# Altium project starfish.PrjPcb
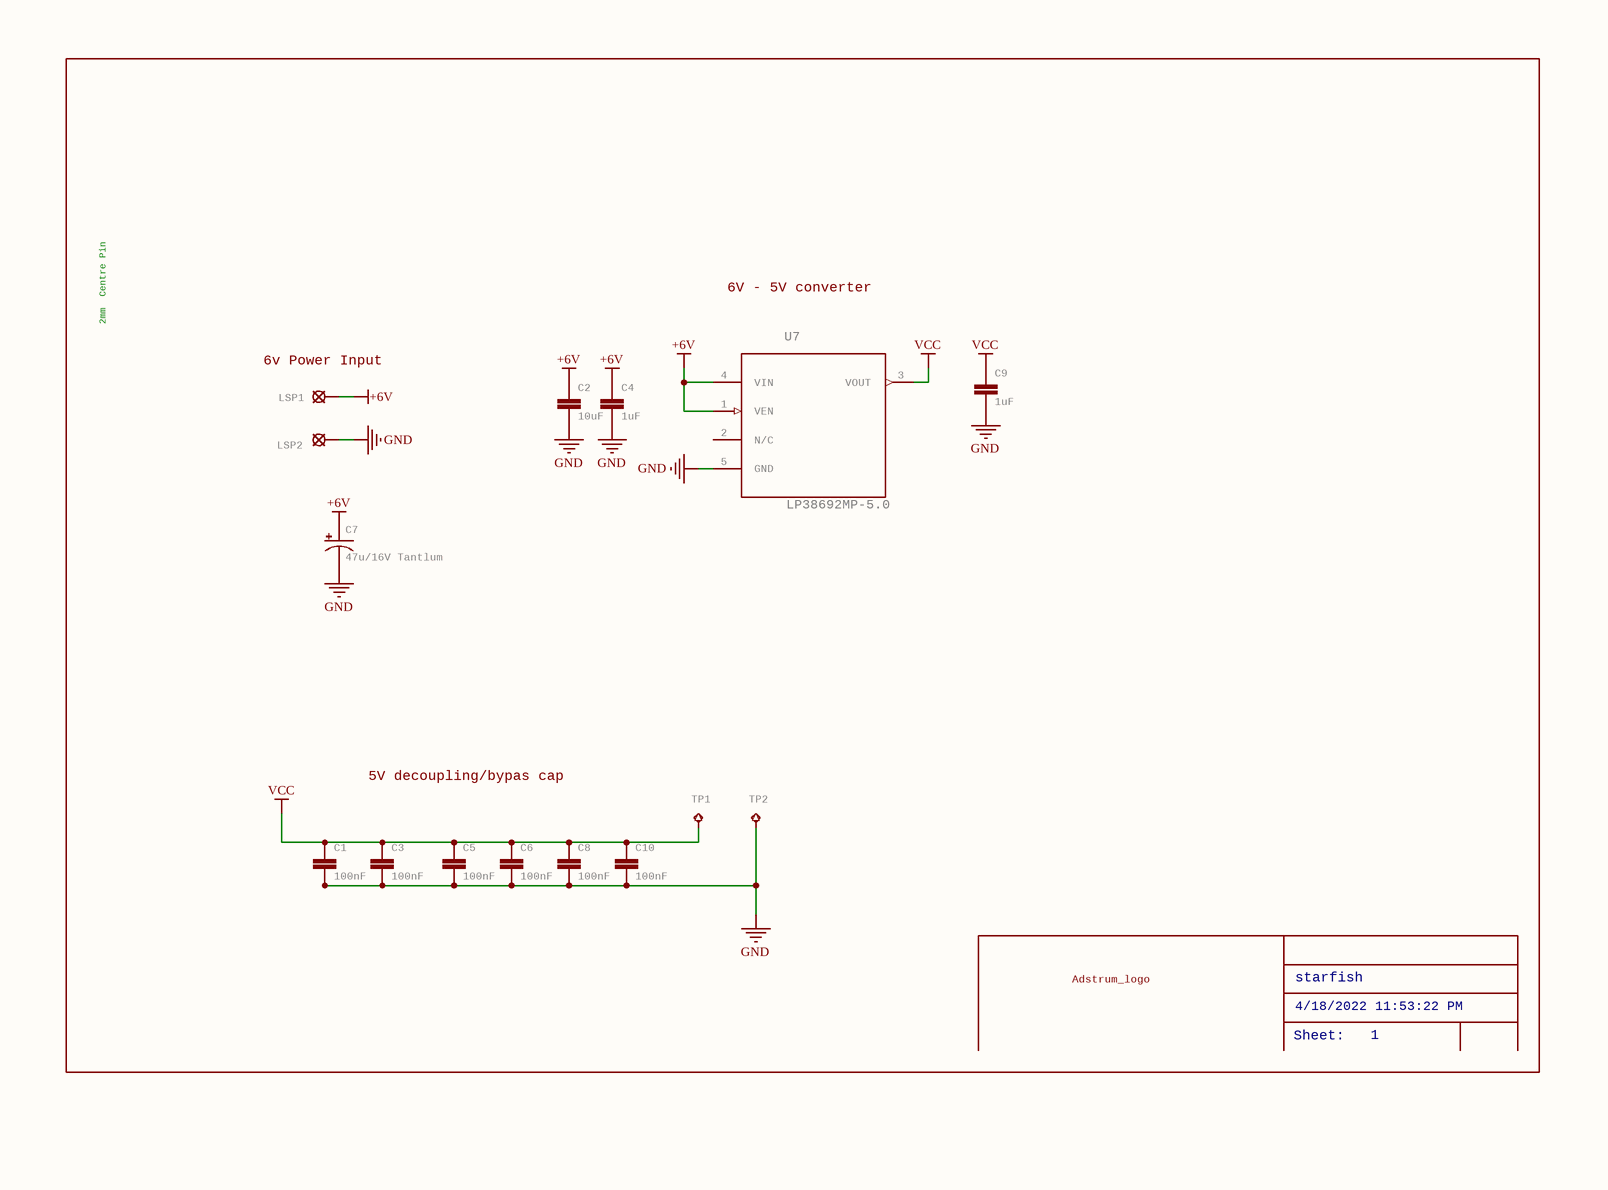
[diagram p0: starfish_0.SchDoc]
6 sheets, 60 parts. Net scope: flat (ports and power ports of the same name join across sheets).
Sheets:
  starfish_0.SchDoc
  starfish_1.SchDoc
  starfish_2.SchDoc
  starfish_3.SchDoc
  starfish_4.SchDoc
  starfish_5.SchDoc

## Sheet starfish_0.SchDoc: starfish
size 282 x 208 mm; Origin: Eagle; Date: 4/18/2022 11:53:22 PM; SheetNumber: 1; GateName_1: G$1; SymbolName_1: A4L-LOC; LibraryName: frames; DeviceSetName: A4L-LOC; Sheet: Sheet:

### Parts
C1  100nF  [C1210]
C2  10uF  [C0805]
C3  100nF  [C0603]
C4  1uF  [C0805]
C5  100nF  [C0603]
C6  100nF  [C0603]
C7  47u/16V Tantlum  [C/6032-28R]
C8  100nF  [C0603]
C9  1uF  [C0805]
C10  100nF  [C0603]
LSP1  LSP10  [LSP10]  (value not drawn)
LSP2  LSP10  [LSP10]  (value not drawn)
TP1  vcc  [B1,27]  (value not drawn)
TP2  gnd  [B1,27]  (value not drawn)
U7  LP38692MP-5.0  [SOT150P696X180-5N]
U$16  ADSTRUM_LOGO  [ADSTRUM_LOGO]

### Nets
+6V: C2.1 C4.1 C7.+ LSP1.MP U7.1(VEN) U7.4(VIN)
GND: C1.2 C2.2 C3.2 C4.2 C5.2 C6.2 C7.- C8.2 C9.2 C10.2 LSP2.MP TP2.TP U7.5(GND)
VCC: C1.1 C3.1 C5.1 C6.1 C8.1 C9.1 C10.1 TP1.TP U7.3(VOUT)

Not connected (* = marked no-connect by the designer): U7 2(N/C)

### Notes on the sheet
- 2mm  Centre Pin
- 6V - 5V converter
- (near LSP1) 6v Power Input
- 5V decoupling/bypas cap
- starfish
- Sheet:
- 4/18/2022 11:53:22 PM
- 1

### Library data of the parts
C1 = C-EUC1210: CAPACITOR, European symbol; GateName_1: G$1; SymbolName_1: C-EU; DeviceName: C1210; LibraryName: resistor; DeviceSetName: C-EU
C2 C4 C9 = C-EUC0805: CAPACITOR, European symbol; GateName_1: G$1; SymbolName_1: C-EU; DeviceName: C0805; LibraryName: resistor; DeviceSetName: C-EU
C3 C5 C6 C8 C10 = C-EUC0603: CAPACITOR, European symbol; GateName_1: G$1; SymbolName_1: C-EU; DeviceName: C0603; LibraryName: resistor; DeviceSetName: C-EU
C7 = CPOL-USC/6032-28R: POLARIZED CAPACITOR, American symbol; GateName_1: G$1; POPULARITY: 0; SymbolName_1: CPOL-US; DeviceName: C/6032-28R; LibraryName: rcl; DeviceSetName: CPOL-US; SPICEPREFIX: C
LSP1 LSP2 = LSP10: SOLDER PAD    drill 1.0 mm, distributor Buerklin, 12H555; GateName_1: 1; SymbolName_1: LSP; POPULARITY: 52; LibraryName: solpad; DeviceSetName: LSP10
TP1 TP2 = TPB1,27: Test pad; GateName_1: G$1; SymbolName_1: TP; POPULARITY: 19; DeviceName: B1,27; LibraryName: testpad; DeviceSetName: TP
U7 = LP38692MP-5.0: Linear  Regulator Check availability; GateName_1: A; DESCRIPTION: 1-A, 10-V, low-dropout voltage regulator with enable; MF: Texas Instruments; MP: LP38692MP-5.0/NOPB; SymbolName_1: LP38692MP-5.0; LibraryName: LP38692MP-5.0; DeviceSetName: LP38692MP-5.0; AVAILABILITY: In Stock; PACKAGE: SOT-223-5 Texas Instruments; PRICE: None; PURCHASE-URL: https://pricing.snapeda.com/search/part/LP38692MP-5.0/NOPB/?ref=eda
U$16 = ADSTRUM_LOGO: ADSTRUM LOGO; GateName_1: G$1; SymbolName_1: ADSTRUM_LOGO; LibraryName: ADSTRUM_LOGO; DeviceSetName: ADSTRUM_LOGO; Adstrum_logo: Adstrum_logo

## Sheet starfish_1.SchDoc: starfish
size 409 x 289 mm; Origin: Eagle; Date: 4/18/2022 11:53:22 PM; SheetNumber: 2; GateName_1: G$1; SymbolName_1: A3L-LOC; LibraryName: frames; DeviceSetName: A3L-LOC; Sheet: Sheet:
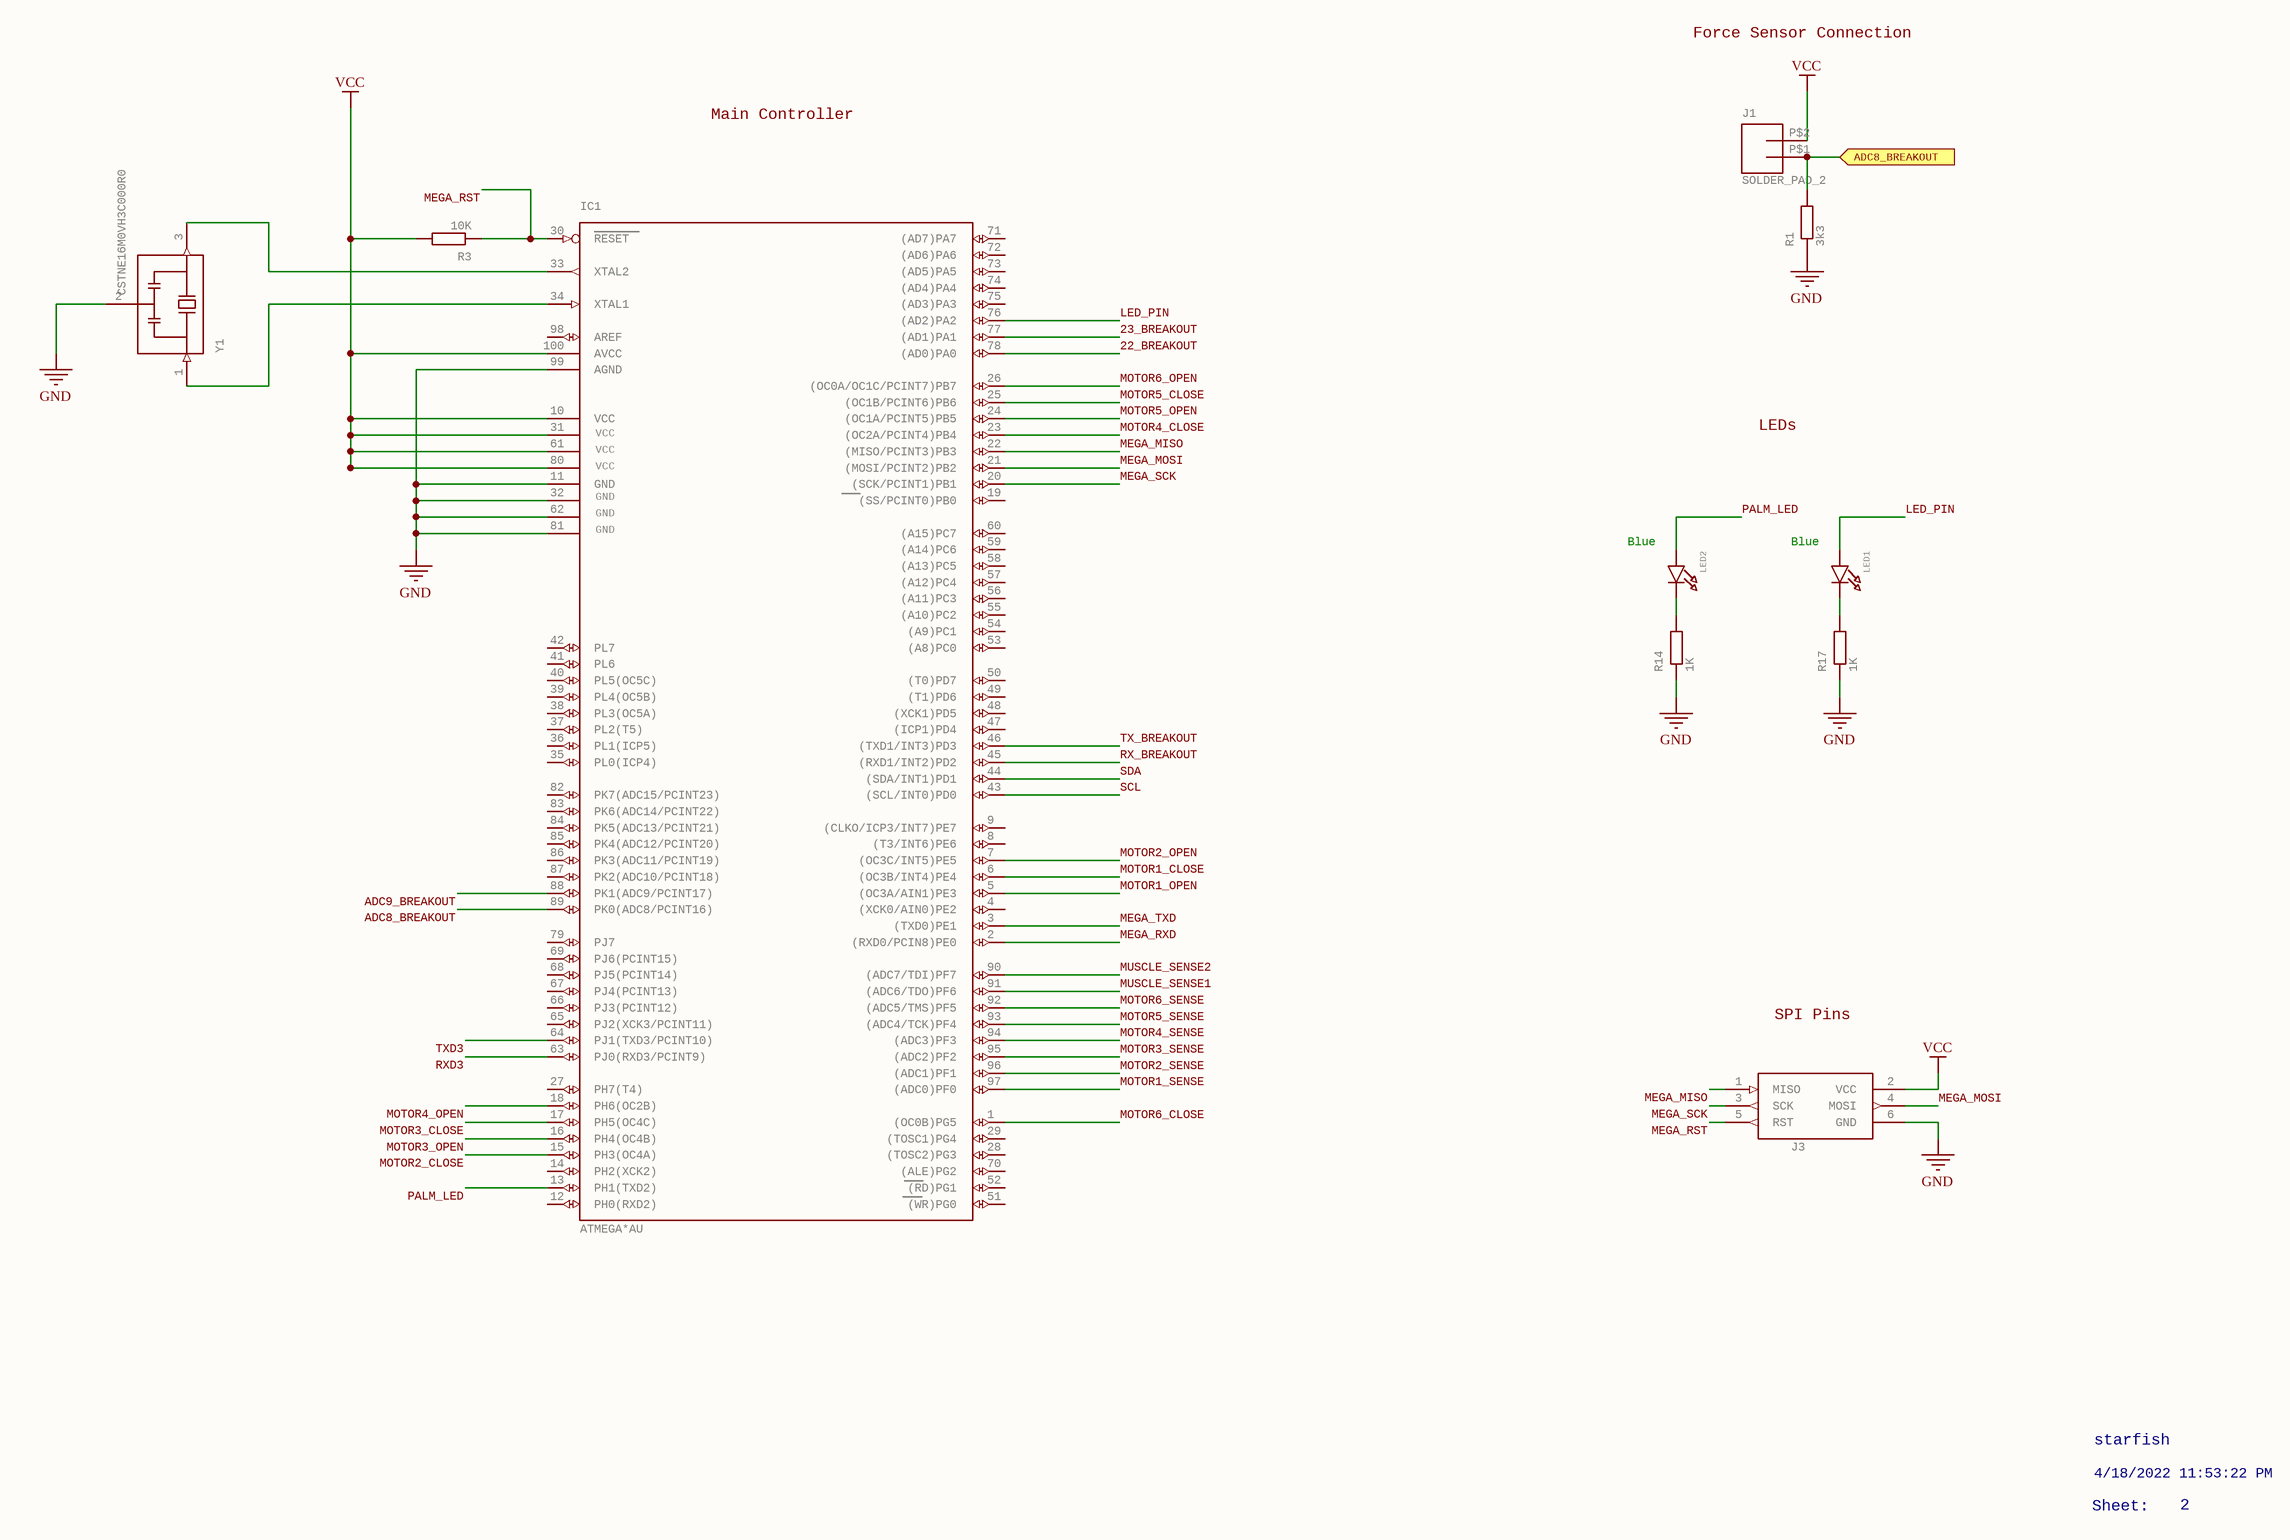
[diagram p1: starfish_1.SchDoc]

### Parts
IC1  ATMEGA*AU  [TQFP100]
J1  SOLDER_PAD_2  [SOLDER_PAD_2]
J3  DNF  [AVRISP]  (value not drawn)
LED1  LED0805  [CHIPLED_0805]  (value not drawn)
LED2  LED0805  [CHIPLED_0805]  (value not drawn)
R1  3k3  [R0603]
R3  10K  [R0603]
R14  1K  [R0603]
R17  1K  [R0603]
Y1  CSTNE16M0VH3C000R0  [OSC_CSTNE16M0VH3C000R0]

### Ports
ADC8_BREAKOUT (in)

### Nets
GND: IC1.11(GND) IC1.32(GND1) IC1.62(GND2) IC1.81(GND3) IC1.99(AGND) J3.6(GND) R1.1 R14.1 R17.1 Y1.2(GND)
VCC: IC1.10(VCC) IC1.31(VCC1) IC1.61(VCC2) IC1.80(VCC3) IC1.100(AVCC) J1.P$2 J3.2(VCC) R3.2
22_BREAKOUT: IC1.78((AD0)PA0)
23_BREAKOUT: IC1.77((AD1)PA1)
ADC8_BREAKOUT: IC1.89(PK0(ADC8/PCINT16))
ADC9_BREAKOUT: IC1.88(PK1(ADC9/PCINT17))
LED_PIN: IC1.76((AD2)PA2) LED1.A
MEGA_MISO: IC1.22((MISO/PCINT3)PB3) J3.1(MISO)
MEGA_MOSI: IC1.21((MOSI/PCINT2)PB2) J3.4(MOSI)
MEGA_RST: IC1.30(RESET) J3.5(RST) R3.1
MEGA_RXD: IC1.2((RXD0/PCIN8)PE0)
MEGA_SCK: IC1.20((SCK/PCINT1)PB1) J3.3(SCK)
MEGA_TXD: IC1.3((TXD0)PE1)
MOTOR1_CLOSE: IC1.6((OC3B/INT4)PE4)
MOTOR1_OPEN: IC1.5((OC3A/AIN1)PE3)
MOTOR1_SENSE: IC1.97((ADC0)PF0)
MOTOR2_CLOSE: IC1.15(PH3(OC4A))
MOTOR2_OPEN: IC1.7((OC3C/INT5)PE5)
MOTOR2_SENSE: IC1.96((ADC1)PF1)
MOTOR3_CLOSE: IC1.17(PH5(OC4C))
MOTOR3_OPEN: IC1.16(PH4(OC4B))
MOTOR3_SENSE: IC1.95((ADC2)PF2)
MOTOR4_CLOSE: IC1.23((OC2A/PCINT4)PB4)
MOTOR4_OPEN: IC1.18(PH6(OC2B))
MOTOR4_SENSE: IC1.94((ADC3)PF3)
MOTOR5_CLOSE: IC1.25((OC1B/PCINT6)PB6)
MOTOR5_OPEN: IC1.24((OC1A/PCINT5)PB5)
MOTOR5_SENSE: IC1.93((ADC4/TCK)PF4)
MOTOR6_CLOSE: IC1.1((OC0B)PG5)
MOTOR6_OPEN: IC1.26((OC0A/OC1C/PCINT7)PB7)
MOTOR6_SENSE: IC1.92((ADC5/TMS)PF5)
MUSCLE_SENSE1: IC1.91((ADC6/TDO)PF6)
MUSCLE_SENSE2: IC1.90((ADC7/TDI)PF7)
PALM_LED: IC1.13(PH1(TXD2)) LED2.A
RX_BREAKOUT: IC1.45((RXD1/INT2)PD2)
RXD3: IC1.63(PJ0(RXD3/PCINT9))
SCL: IC1.43((SCL/INT0)PD0)
SDA: IC1.44((SDA/INT1)PD1)
TX_BREAKOUT: IC1.46((TXD1/INT3)PD3)
TXD3: IC1.64(PJ1(TXD3/PCINT10))
NetIC1_33: IC1.33(XTAL2) Y1.3(OUT)
NetIC1_34: IC1.34(XTAL1) Y1.1(IN)
NetJ1_P$1: J1.P$1 R1.2 ; port ADC8_BREAKOUT
NetLED1_C: LED1.C R17.2
NetLED2_C: LED2.C R14.2

Not connected (* = marked no-connect by the designer): IC1 4((XCK0/AIN0)PE2) 8((T3/INT6)PE6) 9((CLKO/ICP3/INT7)PE7) 12(PH0(RXD2)) 14(PH2(XCK2)) 19((SS/PCINT0)PB0) 27(PH7(T4)) 28((TOSC2)PG3) 29((TOSC1)PG4) 35(PL0(ICP4)) 36(PL1(ICP5)) 37(PL2(T5)) 38(PL3(OC5A)) 39(PL4(OC5B)) 40(PL5(OC5C)) 41(PL6) 42(PL7) 47((ICP1)PD4) 48((XCK1)PD5) 49((T1)PD6) 50((T0)PD7) 51((WR)PG0) 52((RD)PG1) 53((A8)PC0) 54((A9)PC1) 55((A10)PC2) 56((A11)PC3) 57((A12)PC4) 58((A13)PC5) 59((A14)PC6) 60((A15)PC7) 65(PJ2(XCK3/PCINT11)) 66(PJ3(PCINT12)) 67(PJ4(PCINT13)) 68(PJ5(PCINT14)) 69(PJ6(PCINT15)) 70((ALE)PG2) 71((AD7)PA7) 72((AD6)PA6) 73((AD5)PA5) 74((AD4)PA4) 75((AD3)PA3) 79(PJ7) 82(PK7(ADC15/PCINT23)) 83(PK6(ADC14/PCINT22)) 84(PK5(ADC13/PCINT21)) 85(PK4(ADC12/PCINT20)) 86(PK3(ADC11/PCINT19)) 87(PK2(ADC10/PCINT18)) 98(AREF)

### Notes on the sheet
- Force Sensor Connection
- Main Controller
- LEDs
- (near LED2) Blue
- (near LED1) Blue
- SPI Pins
- starfish
- Sheet:
- 4/18/2022 11:53:22 PM
- 2

### Library data of the parts
IC1 = ATMEGA*AU: MICROCONTROLLER   64/128/256 Kbytes FLASH   4 Kbytes EEPROM   8 Kbytes SRAM   86 General Purpose I/O pins   12-channels16-bit PWM   4 x Serial USARTs   16-channels 10-bit A/D; GateName_1: 1; SymbolName_1: 86-I/O-1; DeviceName: AU; LibraryName: atmel-2005; DeviceSetName: ATMEGA*; GND: GND; VCC: VCC
J1 = SOLDER_PAD_2: Solder Pad for LuMini Rings; GateName_1: G$1; SymbolName_1: CONN_02; LibraryName: SparkFun-Connectors; DeviceSetName: SOLDER_PAD_2
J3 = AVRISP-6: AVR ISP HEADER Standard 6 pin header for AVR programming; GateName_1: G$1; DeviceName: -6; SymbolName_1: AVRISP; LibraryName: adafruit; DeviceSetName: AVRISP
LED1 LED2 = LED0805: LED0603 - 0603 Surface Mount Package    2mA: Green LED - Low Power (3.9mcd, 2ma, 1.7Vf) - Digikey: 475-2709-2-ND  Orange LED - Low Power (9.8mcd, 2ma, 1.8Vf) - Digikey: 475-1194-2-ND  Red LED - Low Power (5mcd, 2ma, 1.8Vf) - Digikey: 475-1195-2-ND  Yellow LED - Low Power (7mcd, 2ma, 1.8Vf) - Digikey: 475-1196-2-ND       5mA: Blue LED - Low Power (17mcd, 5ma, 2.9Vf) - Digikey: LNJ937W8CRACT-ND    0805 - 0805 Surface Mount Package    2mA: Red LED (8.8mcd, 2mA, 1.8Vf, Clear) - Low Power [Digikey: 475-2510-1-ND]  Green LED (5mcd, 2mA, 1.8Vf, Clear) - Low Power [Digikey: 475-2730-1-ND]  Yellow LED (11.3mcd, 2mA, 1.8Vf, Clear) - Low Power [Digikey: 475-2555-1-ND]       20mA: Red LED (104mcd, 20mA, Diffused) - LS R976 [Digikey: 475-1278-6-ND]  Red LED (12mcd, 20mA, 2.0Vf, Clear) - APT2012EC [Digikey: 754-1128-1-ND]  Green LED (15mcd, 20mA, 2.2Vf, Clear) - APT2012GC [Digikey: 754-1131-1-ND]  Orange LED (160mcd, 20mA, 2.1Vf, Clear) - APT2012SECK [Digikey: 754-1130-1-ND]     1206 - 1206 Surface Mount Package  Green LED (26mcd, 20mA, Diffused) - LG N971  [Digikey: 475-1407-6-ND]  Red LED (15mcd, 20mA, Diffused) - LH N974 [Digikey: 475-1416-6-ND]; GateName_1: G$1; DeviceName: 0805; SymbolName_1: LED; LibraryName: microbuilder; DeviceSetName: LED
R1 R3 R14 R17 = R-EU_R0603: RESISTOR, European symbol; GateName_1: G$1; SymbolName_1: R-EU; DeviceSetName: R-EU_; DeviceName: R0603; LibraryName: resistor
Y1 = CSTNE16M0VH3C000R0: 16MHz Ceramic Resonator Built in Capacitor 15pF Â±0.15% 40 Ohms -40Â°C ~ 125Â°C Surface Mount  Check availability; GateName_1: G$1; DESCRIPTION: 16 MHz Ceramic Resonator Built in Capacitor 15 pF ±0.13% 40 Ohms -40°C ~ 125°C Surface Mount; MF: Murata Electronics North America; SymbolName_1: CSTNE16M0VH3C000R0; LibraryName: CSTNE16M0VH3C000R0; DeviceSetName: CSTNE16M0VH3C000R0; AVAILABILITY: In Stock; MP: CSTNE16M0VH3C000R0; PACKAGE: SMD-3 Murata; PRICE: None; PURCHASE-URL: https://pricing.snapeda.com/search/part/CSTNE16M0VH3C000R0/?ref=eda

## Sheet starfish_2.SchDoc: starfish
size 282 x 208 mm; Origin: Eagle; Date: 4/18/2022 11:53:22 PM; SheetNumber: 3; GateName_1: G$1; SymbolName_1: A4L-LOC; LibraryName: frames; DeviceSetName: A4L-LOC; Sheet: Sheet:
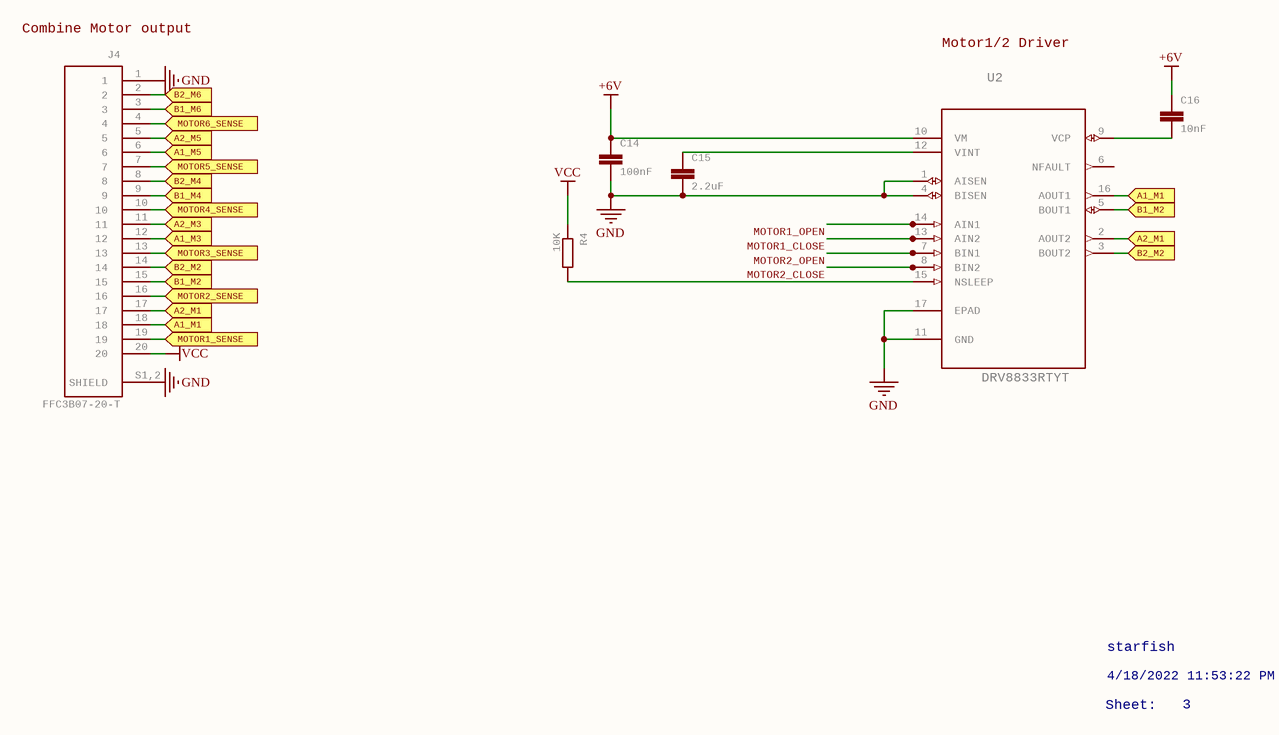
[diagram p2: starfish_2.SchDoc]

### Parts
C14  100nF  [C0603]
C15  2.2uF  [C0603]
C16  10nF  [C0603]
J4  FFC3B07-20-T  [GCT_FFC3B07-20-T]
R4  10K  [R0603]
U2  DRV8833RTYT  [QFN65P400X400X80-17N]

### Ports
A1_M1 (in), A1_M3 (in), A1_M5 (in), A2_M1 (in), A2_M3 (in), A2_M5 (in), B1_M2 (in), B1_M4 (in), B1_M6 (in), B2_M2 (in), B2_M4 (in), B2_M6 (in), MOTOR1_SENSE (in), MOTOR2_SENSE (in), MOTOR3_SENSE (in), MOTOR4_SENSE (in), MOTOR5_SENSE (in), MOTOR6_SENSE (in)

### Nets
+6V: C14.1 C16.1 U2.10(VM)
GND: C14.2 C15.2 J4.1 J4.S1,2(SHIELD) U2.1(AISEN) U2.4(BISEN) U2.11(GND) U2.17(EPAD)
VCC: J4.20 R4.1
MOTOR1_CLOSE: U2.13(AIN2)
MOTOR1_OPEN: U2.14(AIN1)
MOTOR2_CLOSE: U2.8(BIN2)
MOTOR2_OPEN: U2.7(BIN1)
NetC15_1: C15.1 U2.12(VINT)
NetC16_2: C16.2 U2.9(VCP)
NetJ4_2: J4.2 ; port B2_M6
NetJ4_3: J4.3 ; port B1_M6
NetJ4_4: J4.4 ; port MOTOR6_SENSE
NetJ4_5: J4.5 ; port A2_M5
NetJ4_6: J4.6 ; port A1_M5
NetJ4_7: J4.7 ; port MOTOR5_SENSE
NetJ4_8: J4.8 ; port B2_M4
NetJ4_9: J4.9 ; port B1_M4
NetJ4_10: J4.10 ; port MOTOR4_SENSE
NetJ4_11: J4.11 ; port A2_M3
NetJ4_12: J4.12 ; port A1_M3
NetJ4_13: J4.13 ; port MOTOR3_SENSE
NetJ4_14: J4.14 U2.3(BOUT2) ; port B2_M2
NetJ4_15: J4.15 U2.5(BOUT1) ; port B1_M2
NetJ4_16: J4.16 ; port MOTOR2_SENSE
NetJ4_17: J4.17 U2.2(AOUT2) ; port A2_M1
NetJ4_18: J4.18 U2.16(AOUT1) ; port A1_M1
NetJ4_19: J4.19 ; port MOTOR1_SENSE
NetR4_2: R4.2 U2.15(NSLEEP)

Not connected (* = marked no-connect by the designer): U2 6(NFAULT)

### Notes on the sheet
- (near J4) Combine Motor output
- Motor1/2 Driver
- starfish
- Sheet:
- 4/18/2022 11:53:22 PM
- 3

### Library data of the parts
C14-C16 = C-EUC0603: as C3 on sheet starfish_0; DeviceName: C0603; LibraryName: resistor; DeviceSetName: C-EU
J4 = FFC3B07-20-T: FPC 1.0mm Pitch, Side entry, Top contact, SMT, Height 2.5mm, Slide type Check availability; GateName_1: G$1; DESCRIPTION: 20 Position FFC, FPC Connector Contacts, Bottom 0.039 (1.00mm) Surface Mount, Right Angle; MF: Global Connector Technology; SymbolName_1: FFC3B07-20-T; LibraryName: FFC3B07-20-T; DeviceSetName: FFC3B07-20-T; AVAILABILITY: In Stock; MP: FFC3B07-20-T; PACKAGE: None; PRICE: None; PURCHASE-URL: https://pricing.snapeda.com/search/part/FFC3B07-20-T/?ref=eda
R4 = R-EU_R0603: as R1 on sheet starfish_1; DeviceName: R0603; LibraryName: resistor
U2 = DRV8833RTYT: DUAL H-BRIDGE MOTOR DRIVER,QFN-16; GateName_1: A; SymbolName_1: DRV8833RTYT; LibraryName: DRV8833RTYT; DeviceSetName: DRV8833RTYT; MPN: DRV8833RTYT; OC_FARNELL: 2057087; OC_NEWARK: 64T2942; PACKAGE: QFN-16; SUPPLIER: TEXAS INSTRUMENTS

## Sheet starfish_3.SchDoc: starfish
size 282 x 208 mm; Origin: Eagle; Date: 4/18/2022 11:53:22 PM; SheetNumber: 4; GateName_1: G$1; SymbolName_1: A4L-LOC; LibraryName: frames; DeviceSetName: A4L-LOC; Sheet: Sheet:
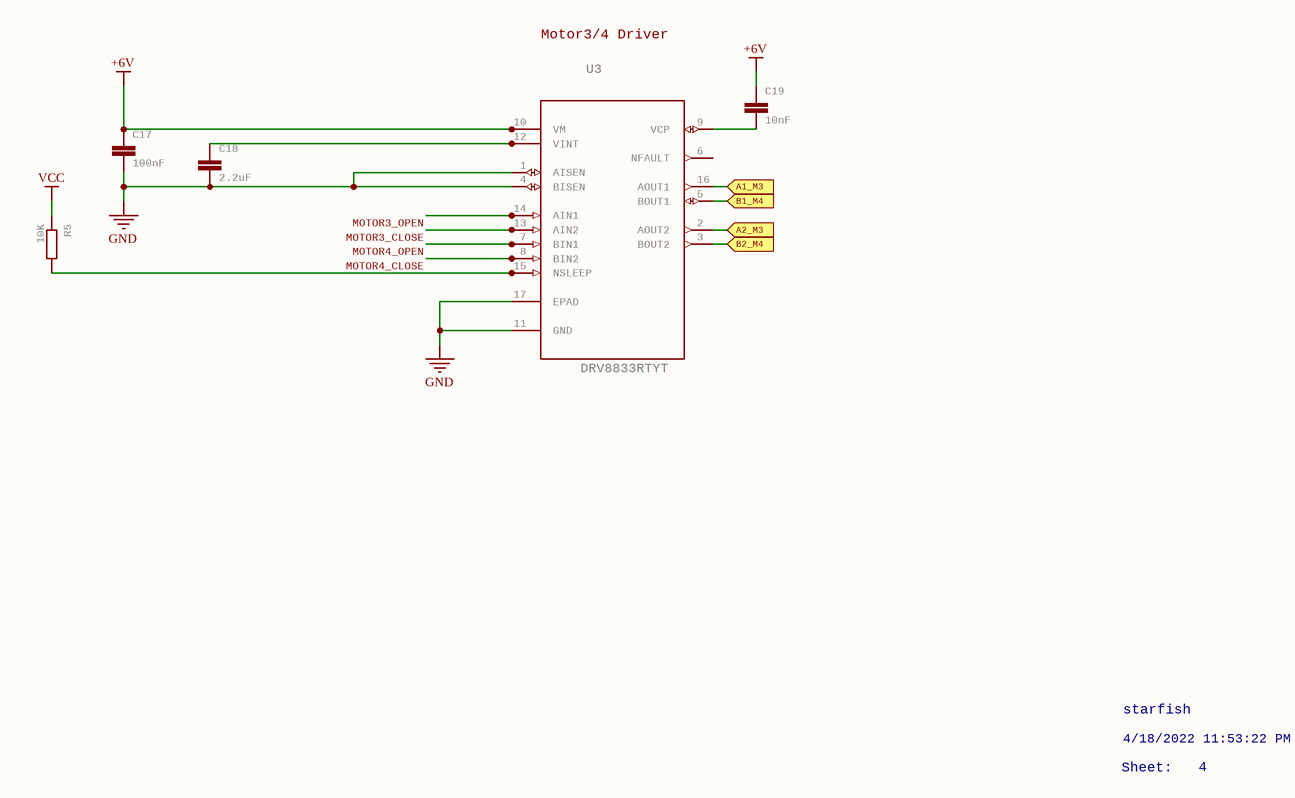
[diagram p3: starfish_3.SchDoc]

### Parts
C17  100nF  [C0603]
C18  2.2uF  [C0603]
C19  10nF  [C0603]
R5  10K  [R0603]
U3  DRV8833RTYT  [QFN65P400X400X80-17N]

### Ports
A1_M3 (in), A2_M3 (in), B1_M4 (in), B2_M4 (in)

### Nets
+6V: C17.1 C19.1 U3.10(VM)
GND: C17.2 C18.2 U3.1(AISEN) U3.4(BISEN) U3.11(GND) U3.17(EPAD)
VCC: R5.1
MOTOR3_CLOSE: U3.13(AIN2)
MOTOR3_OPEN: U3.14(AIN1)
MOTOR4_CLOSE: U3.8(BIN2)
MOTOR4_OPEN: U3.7(BIN1)
NetC18_1: C18.1 U3.12(VINT)
NetC19_2: C19.2 U3.9(VCP)
NetJ4_8: U3.3(BOUT2) ; port B2_M4
NetJ4_9: U3.5(BOUT1) ; port B1_M4
NetJ4_11: U3.2(AOUT2) ; port A2_M3
NetJ4_12: U3.16(AOUT1) ; port A1_M3
NetR5_2: R5.2 U3.15(NSLEEP)

Not connected (* = marked no-connect by the designer): U3 6(NFAULT)

### Notes on the sheet
- Motor3/4 Driver
- starfish
- Sheet:
- 4/18/2022 11:53:22 PM
- 4

### Library data of the parts
C17-C19 = C-EUC0603: as C3 on sheet starfish_0; DeviceName: C0603; LibraryName: resistor; DeviceSetName: C-EU
R5 = R-EU_R0603: as R1 on sheet starfish_1; DeviceName: R0603; LibraryName: resistor
U3 = DRV8833RTYT: as U2 on sheet starfish_2; SymbolName_1: DRV8833RTYT; LibraryName: DRV8833RTYT; DeviceSetName: DRV8833RTYT; MPN: DRV8833RTYT; OC_FARNELL: 2057087; OC_NEWARK: 64T2942; PACKAGE: QFN-16; SUPPLIER: TEXAS INSTRUMENTS

## Sheet starfish_4.SchDoc: starfish
size 282 x 208 mm; Origin: Eagle; Date: 4/18/2022 11:53:22 PM; SheetNumber: 5; GateName_1: G$1; SymbolName_1: A4L-LOC; LibraryName: frames; DeviceSetName: A4L-LOC; Sheet: Sheet:
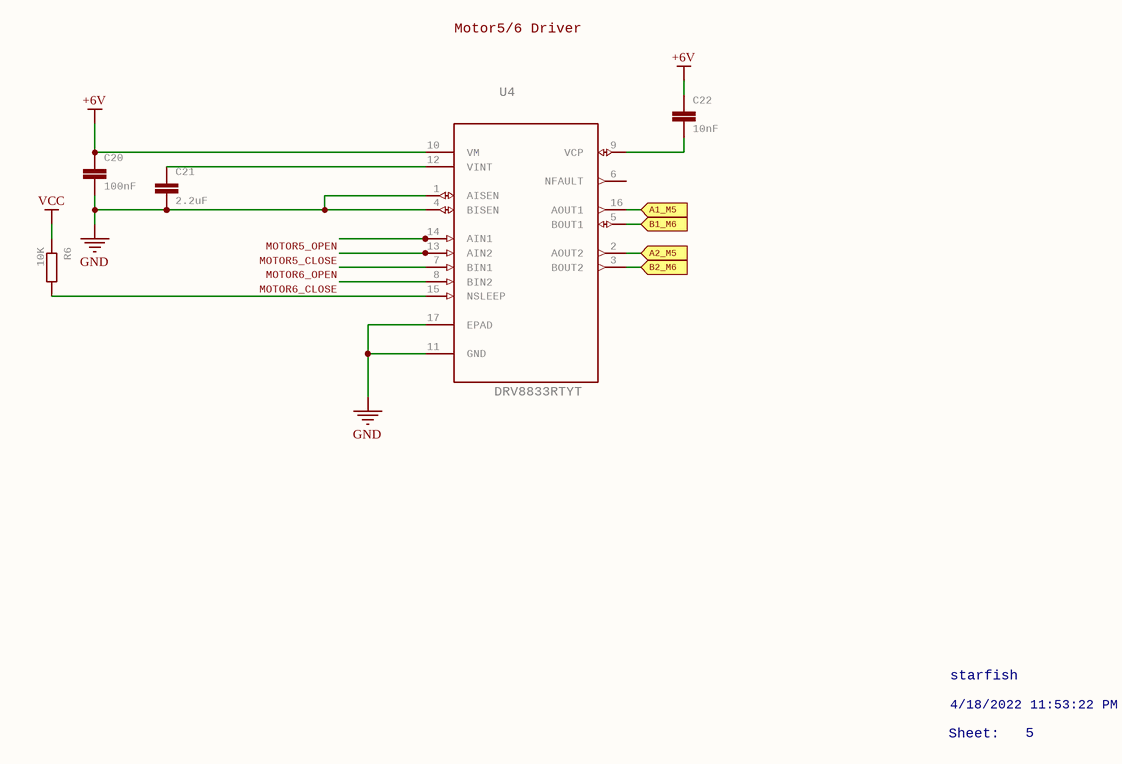
[diagram p4: starfish_4.SchDoc]

### Parts
C20  100nF  [C0603]
C21  2.2uF  [C0603]
C22  10nF  [C0603]
R6  10K  [R0603]
U4  DRV8833RTYT  [QFN65P400X400X80-17N]

### Ports
A1_M5 (in), A2_M5 (in), B1_M6 (in), B2_M6 (in)

### Nets
+6V: C20.1 C22.1 U4.10(VM)
GND: C20.2 C21.2 U4.1(AISEN) U4.4(BISEN) U4.11(GND) U4.17(EPAD)
VCC: R6.1
MOTOR5_CLOSE: U4.13(AIN2)
MOTOR5_OPEN: U4.14(AIN1)
MOTOR6_CLOSE: U4.8(BIN2)
MOTOR6_OPEN: U4.7(BIN1)
NetC21_1: C21.1 U4.12(VINT)
NetC22_2: C22.2 U4.9(VCP)
NetJ4_2: U4.3(BOUT2) ; port B2_M6
NetJ4_3: U4.5(BOUT1) ; port B1_M6
NetJ4_5: U4.2(AOUT2) ; port A2_M5
NetJ4_6: U4.16(AOUT1) ; port A1_M5
NetR6_2: R6.2 U4.15(NSLEEP)

Not connected (* = marked no-connect by the designer): U4 6(NFAULT)

### Notes on the sheet
- Motor5/6 Driver
- starfish
- Sheet:
- 4/18/2022 11:53:22 PM
- 5

### Library data of the parts
C20-C22 = C-EUC0603: as C3 on sheet starfish_0; DeviceName: C0603; LibraryName: resistor; DeviceSetName: C-EU
R6 = R-EU_R0603: as R1 on sheet starfish_1; DeviceName: R0603; LibraryName: resistor
U4 = DRV8833RTYT: as U2 on sheet starfish_2; SymbolName_1: DRV8833RTYT; LibraryName: DRV8833RTYT; DeviceSetName: DRV8833RTYT; MPN: DRV8833RTYT; OC_FARNELL: 2057087; OC_NEWARK: 64T2942; PACKAGE: QFN-16; SUPPLIER: TEXAS INSTRUMENTS

## Sheet starfish_5.SchDoc: starfish
size 282 x 208 mm; Origin: Eagle; Date: 4/18/2022 11:53:22 PM; SheetNumber: 6; GateName_1: G$1; SymbolName_1: A4L-LOC; LibraryName: frames; DeviceSetName: A4L-LOC; Sheet: Sheet:
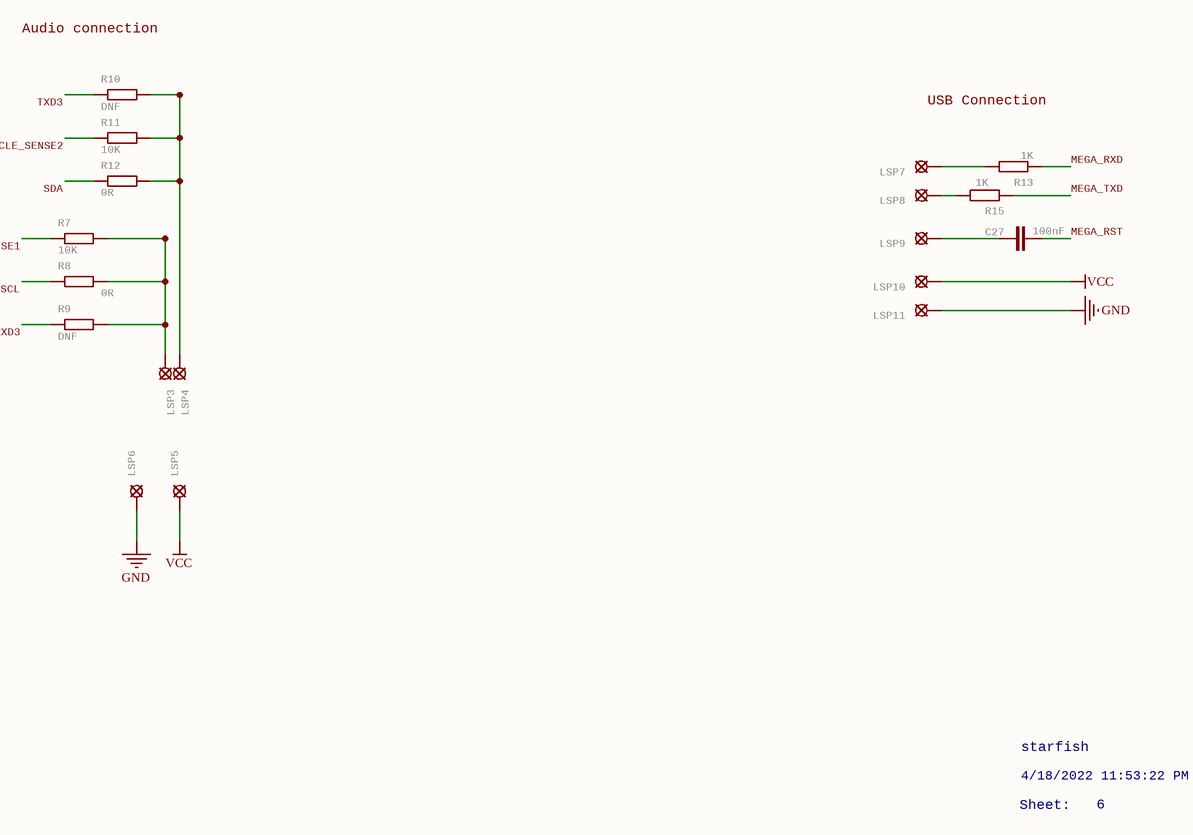
[diagram p5: starfish_5.SchDoc]

### Parts
C27  100nF  [C0603]
LSP3  LSP10  [LSP10]  (value not drawn)
LSP4  LSP10  [LSP10]  (value not drawn)
LSP5  LSP10  [LSP10]  (value not drawn)
LSP6  LSP10  [LSP10]  (value not drawn)
LSP7  LSP10  [LSP10]  (value not drawn)
LSP8  LSP10  [LSP10]  (value not drawn)
LSP9  LSP10  [LSP10]  (value not drawn)
LSP10  LSP10  [LSP10]  (value not drawn)
LSP11  LSP10  [LSP10]  (value not drawn)
R7  10K  [R0603]
R8  0R  [R0603]
R9  DNF  [R0603]
R10  DNF  [R0603]
R11  10K  [R0603]
R12  0R  [R0603]
R13  1K  [R0603]
R15  1K  [R0603]

### Nets
GND: LSP6.MP LSP11.MP
VCC: LSP5.MP LSP10.MP
MEGA_RST: C27.2
MEGA_RXD: R13.1
MEGA_TXD: R15.1
MUSCLE_SENSE1: R7.1
MUSCLE_SENSE2: R11.1
RXD3: R9.1
SCL: R8.1
SDA: R12.1
TXD3: R10.1
NetC27_1: C27.1 LSP9.MP
NetLSP3_MP: LSP3.MP R7.2 R8.2 R9.2
NetLSP4_MP: LSP4.MP R10.2 R11.2 R12.2
NetLSP7_MP: LSP7.MP R13.2
NetLSP8_MP: LSP8.MP R15.2

### Notes on the sheet
- Audio connection
- USB Connection
- starfish
- Sheet:
- 4/18/2022 11:53:22 PM
- 6

### Library data of the parts
C27 = C-EUC0603: as C3 on sheet starfish_0; DeviceName: C0603; LibraryName: resistor; DeviceSetName: C-EU
LSP3-LSP11 = LSP10: as LSP1 on sheet starfish_0; LibraryName: solpad; DeviceSetName: LSP10
R7-R13 R15 = R-EU_R0603: as R1 on sheet starfish_1; DeviceName: R0603; LibraryName: resistor

## Nets that join several sheets
+6V: starfish_0 (6 pins), starfish_2 (C14.1 C16.1 U2.10), starfish_3 (C17.1 C19.1 U3.10), starfish_4 (C20.1 C22.1 U4.10)
GND: starfish_0 (13 pins), starfish_1 (10 pins), starfish_2 (8 pins), starfish_3 (6 pins), starfish_4 (6 pins), starfish_5 (LSP6.MP LSP11.MP)
VCC: starfish_0 (9 pins), starfish_1 (8 pins), starfish_2 (J4.20 R4.1), starfish_3 (R5.1), starfish_4 (R6.1), starfish_5 (LSP5.MP LSP10.MP)
NetJ4_2: starfish_2 (J4.2), starfish_4 (U4.3)
NetJ4_3: starfish_2 (J4.3), starfish_4 (U4.5)
NetJ4_5: starfish_2 (J4.5), starfish_4 (U4.2)
NetJ4_6: starfish_2 (J4.6), starfish_4 (U4.16)
NetJ4_8: starfish_2 (J4.8), starfish_3 (U3.3)
NetJ4_9: starfish_2 (J4.9), starfish_3 (U3.5)
NetJ4_11: starfish_2 (J4.11), starfish_3 (U3.2)
NetJ4_12: starfish_2 (J4.12), starfish_3 (U3.16)